# Altium schematic sheet HMS.VS1838B.SchDoc
size A
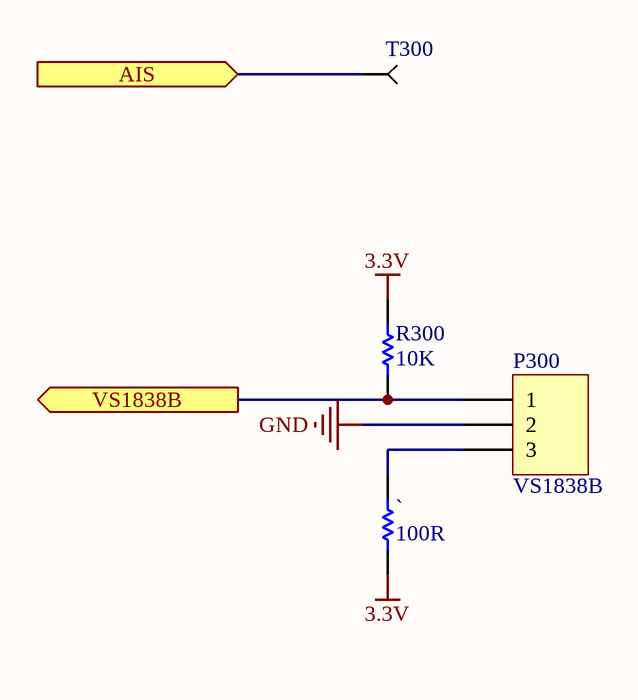
[diagram p0: HMS.VS1838B.SchDoc]

## Parts
`  100R  [RES_0402(1005)]
P300  VS1838B  [IR_RECEIVER]
R300  10K  [RES_0402(1005)]
T300  Test Point  [TP]  (value not drawn)

## Ports
AIS (in), VS1838B (out)

## Nets
3.3V: `.1 R300.2
GND: P300.2
AIS: T300.1 ; port AIS
VS1838B: P300.1 R300.1 ; port VS1838B
Net`_2: `.2 P300.3

## Library data of the parts
` = Res1: RES 100 OHM 1% 1/8W 0402; MPN: RC0402FR-7W100RL; Published: 8-Jun-2000; LatestRevisionDate: 17-Jul-2002; LatestRevisionNote: Re-released for DXP Platform.; PackageReference: AXIAL-0.3; Publisher: Altium Limited; Value: 100R
P300 = Header 3: Diode Infrared Receiver 38Khz; LatestRevisionDate: 17-Jul-2002; LatestRevisionNote: Re-released for DXP Platform.; Publisher: Altium Limited; Value: VS1838B; MPN: VS1838B
R300 = Res1: RES 10K OHM 5% 1/8W 0402; MPN: RC0402JR-0710KL; MFR: Yageo; Published: 8-Jun-2000; LatestRevisionDate: 17-Jul-2002; LatestRevisionNote: Re-released for DXP Platform.; PackageReference: AXIAL-0.3; Publisher: Altium Limited; Value: 10K